# Altium schematic sheet IMU.SchDoc
size A4; SheetNumber: 1; SheetTotal: 1
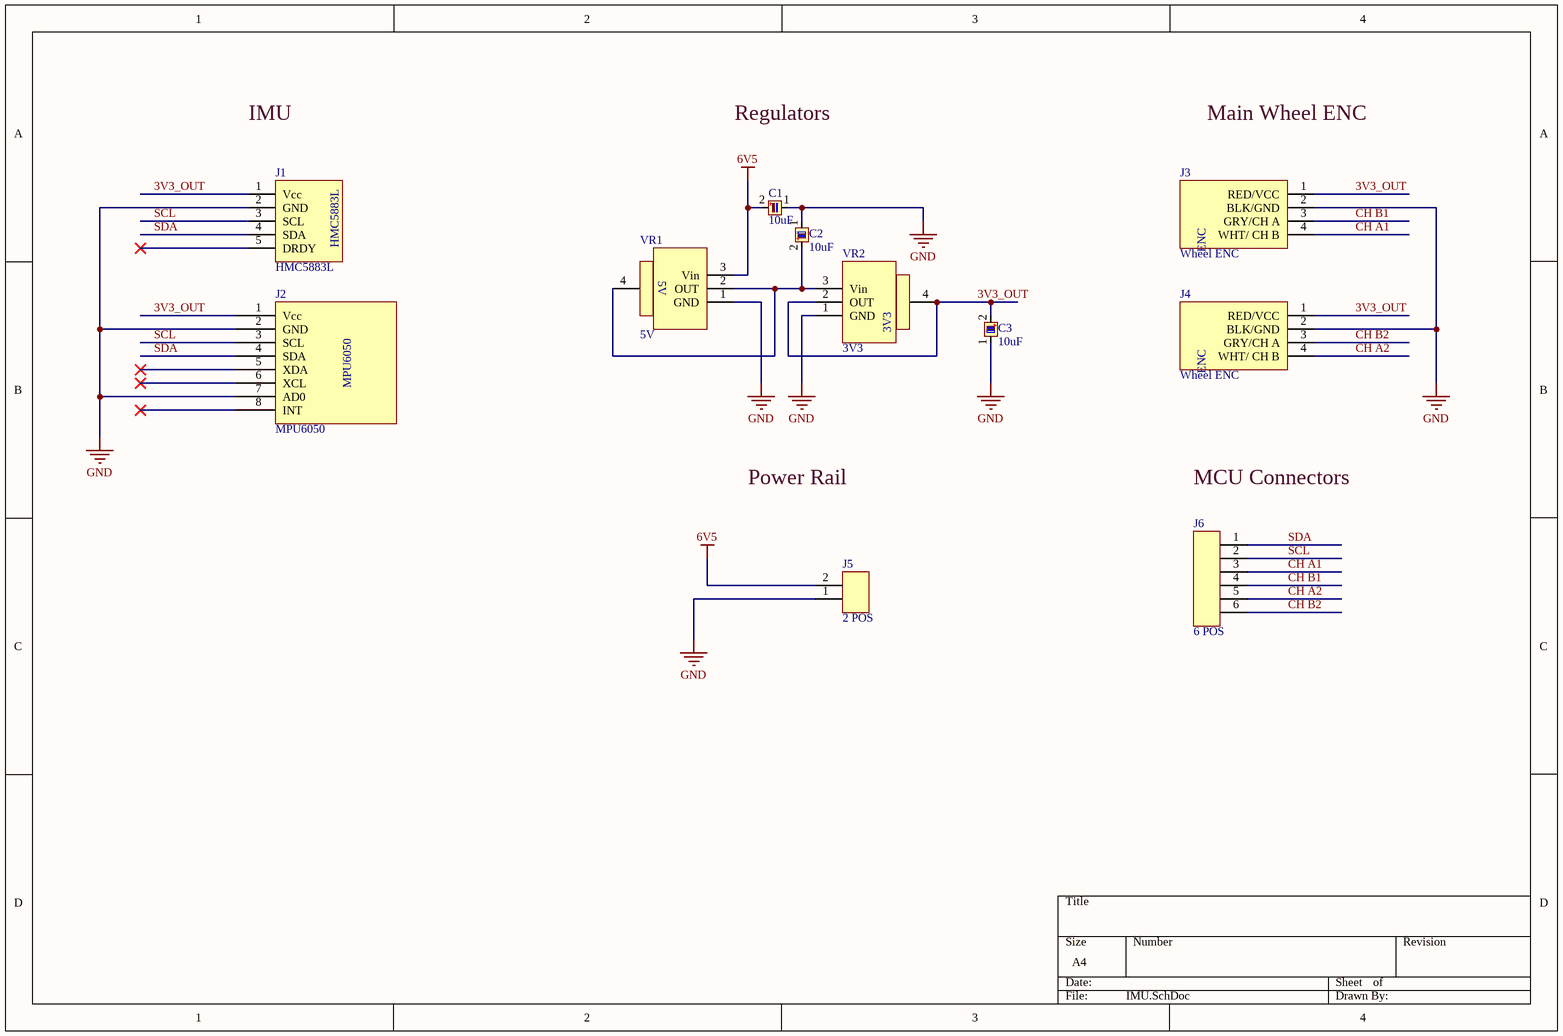
[diagram p0: IMU.SchDoc]

## Parts
C1  10uF  [10uF]
C2  10uF  [10uF]
C3  10uF  [10uF]
J1  HMC5883L  [5 POS HMC]
J2  MPU6050  [8 POS MPU6050]
J3  Wheel ENC  [Wheel ENC]
J4  Wheel ENC  [Wheel ENC]
J5  2 POS  [2 POS]
J6  6 POS  [6 POS]
VR1  5V  [3V3]
VR2  3V3  [3V3]

## Nets
6V5: C1.2 J5.2 VR1.3(Vin)
GND: C1.1 C2.1 C3.1 J1.2(GND) J2.2(GND) J2.7(AD0) J3.2(BLK/GND) J4.2(BLK/GND) J5.1 VR1.1(GND) VR2.1(GND)
3V3_OUT: C3.2 J1.1(Vcc) J2.1(Vcc) J3.1(RED/VCC) J4.1(RED/VCC) VR2.2(OUT) VR2.4(OUT)
CH A1: J3.4(WHT/_CH_B) J6.3
CH A2: J4.4(WHT/_CH_B) J6.5
CH B1: J3.3(GRY/CH_A) J6.4
CH B2: J4.3(GRY/CH_A) J6.6
SCL: J1.3(SCL) J2.3(SCL) J6.2
SDA: J1.4(SDA) J2.4(SDA) J6.1
NetC2_2: C2.2 VR1.2(OUT) VR1.4(OUT) VR2.3(Vin)

Not connected (* = marked no-connect by the designer): J1 5(DRDY)*; J2 5(XDA)* 6(XCL)* 8(INT)*

## Notes on the sheet
- IMU
- Regulators
- Main Wheel ENC
- Power Rail
- MCU Connectors
- (in symbol Wheel ENC) ENC

## Library data of the parts
C1-C3 = 10uF: Pin Header, Board-to-Board, Wire-to-Board, 2.54 mm, 1 Rows, 2 Contacts, Through Hole, HTSW Series; Manufacturer: Samtec; Manufacturer Part Number: HTSW-102-16-T-S; Manufacturer Lifecycle Status: PRODUCTION; Gender: Male; Number of Contacts: 2; Pitch: 2.54mm; Supplier: Avnet; Supplier Part Number: HTSW-102-16-T-S; RoHS: Compliant; Category: Board to Board Connectors; Stock: 2347; Pricing: 1=0.1485, 1000=0.06895, 5000=0.0494, 10000=0.0491, 20000=0.04881 (USD); Contact Material: Bronze; Contact Plating: Tin; Lead Pitch: 2.54mm; Lifecycle Status: Production; Mounting Technology: Through Hole; Number of Rows: 1; Packaging: Bulk; Radiation Hardening: No; REACH SVHC: No; Termination: Solder; ComponentLink1URL: https://datasheet.octopart.com:443/HTSW-102-16-T-S-Samtec-datasheet-97084101.pdf?src-supplier=Samtec; ComponentLink1Description: https://datasheet.octopart.com:443/HTSW-102-16-T-S-Samtec-datasheet-97084101.pdf?src-supplier=Samtec; ComponentLink2URL: https://sigma.octopart.com:443/14433675/technical_drawing/Samtec-HTSW-102-16-T-S.pdf?src-supplier=Samtec; ComponentLink2Description: https://sigma.octopart.com:443/14433675/technical_drawing/Samtec-HTSW-102-16-T-S.pdf?src-supplier=Samtec; ComponentLink3URL: https://datasheet.octopart.com:443/HTSW-102-16-T-S-Samtec-datasheet-150856372.pdf?src-supplier=Sager+Electronics; ComponentLink3Description: https://datasheet.octopart.com:443/HTSW-102-16-T-S-Samtec-datasheet-150856372.pdf?src-supplier=Sager+Electronics; ComponentLink4URL: https://datasheet.octopart.com:443/HTSW-102-16-T-S-Samtec-datasheet-151455181.pdf?src-supplier=Sager+Electronics; ComponentLink4Description: https://datasheet.octopart.com:443/HTSW-102-16-T-S-Samtec-datasheet-151455181.pdf?src-supplier=Sager+Electronics; ComponentLink5URL: https://datasheet.octopart.com:443/HTSW-102-16-T-S-Samtec-datasheet-136646178.pdf?src-supplier=Electro+Sonic; ComponentLink5Description: https://datasheet.octopart.com:443/HTSW-102-16-T-S-Samtec-datasheet-136646178.pdf?src-supplier=Electro+Sonic; ComponentLink6URL: https://datasheet.octopart.com:443/HTSW-102-16-T-S-Samtec-datasheet-62107121.pdf?src-supplier=Farnell; ComponentLink6Description: https://datasheet.octopart.com:443/HTSW-102-16-T-S-Samtec-datasheet-62107121.pdf?src-supplier=Farnell; ComponentLink7URL: https://datasheet.octopart.com:443/HTSW-102-16-T-S-Samtec-datasheet-180249195.pdf?src-supplier=JRH+Electronics; ComponentLink7Description: https://datasheet.octopart.com:443/HTSW-102-16-T-S-Samtec-datasheet-180249195.pdf?src-supplier=JRH+Electronics; ComponentLink8URL: https://datasheet.octopart.com/HTSW-102-16-T-S-Samtec-datasheet-86818365.pdf; ComponentLink8Description: https://datasheet.octopart.com/HTSW-102-16-T-S-Samtec-datasheet-86818365.pdf; ComponentLink9URL: https://datasheet.octopart.com:443/HTSW-102-16-T-S-Samtec-datasheet-21214457.pdf?src-supplier=Newark; ComponentLink9Description: https://datasheet.octopart.com:443/HTSW-102-16-T-S-Samtec-datasheet-21214457.pdf?src-supplier=Newark
J1 = 5 POS HMC: 4POS CONN HEADER VERT  2.54MM; Manufacturer: Samtec; Manufacturer Part Number: HTSW-104-23-T-S; Manufacturer Lifecycle Status: PRODUCTION; Gender: Male; Number of Contacts: 4; Supplier: DigiKey; Supplier Part Number: 612-HTSW-104-23-T-S-ND; RoHS: Compliant; Category: Board to Board Connectors; Pricing: 1=0.33 (USD); Contact Material: Bronze; Contact Plating: Tin; Lead Pitch: 2.54mm; Lifecycle Status: Production; Mounting Technology: Through Hole; Number of Rows: 1; Packaging: Bulk; Pitch: 2.54mm; Radiation Hardening: No; REACH SVHC: No; Termination: Solder; ComponentLink1URL: https://datasheet.octopart.com:443/HTSW-104-23-T-S-Samtec-datasheet-97084101.pdf?src-supplier=Samtec; ComponentLink1Description: https://datasheet.octopart.com:443/HTSW-104-23-T-S-Samtec-datasheet-97084101.pdf?src-supplier=Samtec; ComponentLink2URL: https://sigma.octopart.com:443/14433675/technical_drawing/Samtec-HTSW-104-23-T-S.pdf?src-supplier=Samtec; ComponentLink2Description: https://sigma.octopart.com:443/14433675/technical_drawing/Samtec-HTSW-104-23-T-S.pdf?src-supplier=Samtec; ComponentLink3URL: https://datasheet.octopart.com:443/HTSW-104-23-T-S-Samtec-datasheet-136646178.pdf?src-supplier=Electro+Sonic; ComponentLink3Description: https://datasheet.octopart.com:443/HTSW-104-23-T-S-Samtec-datasheet-136646178.pdf?src-supplier=Electro+Sonic; ComponentLink4URL: https://datasheet.octopart.com:443/HTSW-104-23-T-S-Samtec-datasheet-150856372.pdf?src-supplier=Electro+Sonic; ComponentLink4Description: https://datasheet.octopart.com:443/HTSW-104-23-T-S-Samtec-datasheet-150856372.pdf?src-supplier=Electro+Sonic; ComponentLink5URL: https://datasheet.octopart.com:443/HTSW-104-23-T-S-Samtec-datasheet-62107121.pdf?src-supplier=Farnell; ComponentLink5Description: https://datasheet.octopart.com:443/HTSW-104-23-T-S-Samtec-datasheet-62107121.pdf?src-supplier=Farnell; ComponentLink6URL: https://datasheet.octopart.com:443/HTSW-104-23-T-S-Samtec-datasheet-180249195.pdf?src-supplier=JRH+Electronics; ComponentLink6Description: https://datasheet.octopart.com:443/HTSW-104-23-T-S-Samtec-datasheet-180249195.pdf?src-supplier=JRH+Electronics; ComponentLink7URL: https://datasheet.octopart.com:443/HTSW-104-23-T-S-Samtec-datasheet-151455181.pdf?src-supplier=Sager+Electronics; ComponentLink7Description: https://datasheet.octopart.com:443/HTSW-104-23-T-S-Samtec-datasheet-151455181.pdf?src-supplier=Sager+Electronics; ComponentLink8URL: https://datasheet.octopart.com/HTSW-104-23-T-S-Samtec-datasheet-86818365.pdf; ComponentLink8Description: https://datasheet.octopart.com/HTSW-104-23-T-S-Samtec-datasheet-86818365.pdf; ComponentLink9URL: https://datasheet.octopart.com:443/HTSW-104-23-T-S-Samtec-datasheet-21214457.pdf?src-supplier=Newark; ComponentLink9Description: https://datasheet.octopart.com:443/HTSW-104-23-T-S-Samtec-datasheet-21214457.pdf?src-supplier=Newark
J2 = 8 POS MPU6050: Strip Terminal Block, 8A, 0.5mm2, 1 Row(s), 1 Deck(s); Manufacturer: Phoenix Contact; Manufacturer Part Number: 1945151; Manufacturer Lifecycle Status: AVAILABLE; Approvals: UL; Contact Resistance: 1.8mΩ; Current: 10A; Max Current Rating: 6A; Number of Contacts: 8; Number of Levels: 1; Pitch: 3.5mm; Voltage: 300V; Voltage Rating: 160V; Wire/Cable Gauge: 20AWG; Supplier: Mouser; Supplier Part Number: 651-1945151; RoHS: Compliant; Category: Terminal Blocks; Stock: 5397; Pricing: 1=0.76, 10=0.76, 50=0.76, 100=0.76, 1000=0.76, 10000=0.76 (USD); China RoHS: Compliant; Color: Black; Contact Plating: Tin; Country of Origin: Germany; Current Rating: 8A; Depth: 2.8mm; Export Control Classification Number (ECCN) Code: EAR99; Flammability Rating: UL94 V-0; Housing Color: Black; Harmonized Tariff Schedule (HTS) Code: 8536.90.40.00; Introduction Date: 2002-11-26; Lead Free: Lead Free; Lifecycle Status: Production; Mounting Technology: Solder; Pins: 8; Number of Positions: 8; Number of Positions Per Level: 8; Number of Rows: 1; Orientation: Straight; Packaging: Bulk; REACH SVHC: Unaffected; Termination: Solder; Weight: 869.990166mg; Width: 24.5mm; ComponentLink1URL: https://datasheet.octopart.com:443/1945151-Phoenix-Contact-datasheet-66579491.pdf?src-supplier=element14+APAC; ComponentLink1Description: https://datasheet.octopart.com:443/1945151-Phoenix-Contact-datasheet-66579491.pdf?src-supplier=element14+APAC; ComponentLink2URL: https://datasheet.octopart.com:443/PST-1.0/8-3.5-Phoenix-Contact-datasheet-8822167.pdf?src-supplier=element14+APAC; ComponentLink2Description: https://datasheet.octopart.com:443/PST-1.0/8-3.5-Phoenix-Contact-datasheet-8822167.pdf?src-supplier=element14+APAC; ComponentLink3URL: https://datasheet.octopart.com:443/1945151-Phoenix-Contact-datasheet-175456693.pdf?src-supplier=Master+Electronics; ComponentLink3Description: https://datasheet.octopart.com:443/1945151-Phoenix-Contact-datasheet-175456693.pdf?src-supplier=Master+Electronics; ComponentLink4URL: https://datasheet.octopart.com:443/1945151-Phoenix-Contact-datasheet-154783991.pdf?src-supplier=Electro+Sonic; ComponentLink4Description: https://datasheet.octopart.com:443/1945151-Phoenix-Contact-datasheet-154783991.pdf?src-supplier=Electro+Sonic; ComponentLink5URL: https://datasheet.octopart.com:443/1945151-Phoenix-Contact-datasheet-33525158.pdf?src-supplier=MRO+Stop; ComponentLink5Description: https://datasheet.octopart.com:443/1945151-Phoenix-Contact-datasheet-33525158.pdf?src-supplier=MRO+Stop; ComponentLink6URL: https://datasheet.octopart.com:443/1945151-Phoenix-Contact-datasheet-164875081.pdf?src-supplier=Burklin+Elektronik; ComponentLink6Description: https://datasheet.octopart.com:443/1945151-Phoenix-Contact-datasheet-164875081.pdf?src-supplier=Burklin+Elektronik; ComponentLink7URL: https://datasheet.octopart.com:443/1945151-Phoenix-Contact-datasheet-54101.pdf?src-supplier=DigiKey; ComponentLink7Description: https://datasheet.octopart.com:443/1945151-Phoenix-Contact-datasheet-54101.pdf?src-supplier=DigiKey; ComponentLink8URL: https://datasheet.octopart.com:443/1945151-Phoenix-Contact-datasheet-94777.pdf?src-supplier=RS+(Formerly+Allied+Electronics); ComponentLink8Description: https://datasheet.octopart.com:443/1945151-Phoenix-Contact-datasheet-94777.pdf?src-supplier=RS+(Formerly+Allied+Electronics); ComponentLink9URL: https://datasheet.octopart.com:443/1945151-Phoenix-Contact-datasheet-62084791.pdf?src-supplier=RS+(Formerly+Allied+Electronics); ComponentLink9Description: https://datasheet.octopart.com:443/1945151-Phoenix-Contact-datasheet-62084791.pdf?src-supplier=RS+(Formerly+Allied+Electronics); ComponentLink10URL: http://sigma.octopart.com:80/195219851/materials_sheet/Phoenix-Contact-1945151.pdf?src-supplier=Compliance+Statements; ComponentLink10Description: http://sigma.octopart.com:80/195219851/materials_sheet/Phoenix-Contact-1945151.pdf?src-supplier=Compliance+Statements
J3 J4 = Wheel ENC: 4POS CONN HEADER VERT  2.54MM; Manufacturer: Samtec; Manufacturer Part Number: HTSW-104-23-T-S; Manufacturer Lifecycle Status: PRODUCTION; Gender: Male; Number of Contacts: 4; Supplier: DigiKey; Supplier Part Number: 612-HTSW-104-23-T-S-ND; RoHS: Compliant; Category: Board to Board Connectors; Pricing: 1=0.33 (USD); Contact Material: Bronze; Contact Plating: Tin; Lead Pitch: 2.54mm; Lifecycle Status: Production; Mounting Technology: Through Hole; Number of Rows: 1; Packaging: Bulk; Pitch: 2.54mm; Radiation Hardening: No; REACH SVHC: No; Termination: Solder; ComponentLink1URL: https://datasheet.octopart.com:443/HTSW-104-23-T-S-Samtec-datasheet-97084101.pdf?src-supplier=Samtec; ComponentLink1Description: https://datasheet.octopart.com:443/HTSW-104-23-T-S-Samtec-datasheet-97084101.pdf?src-supplier=Samtec; ComponentLink2URL: https://sigma.octopart.com:443/14433675/technical_drawing/Samtec-HTSW-104-23-T-S.pdf?src-supplier=Samtec; ComponentLink2Description: https://sigma.octopart.com:443/14433675/technical_drawing/Samtec-HTSW-104-23-T-S.pdf?src-supplier=Samtec; ComponentLink3URL: https://datasheet.octopart.com:443/HTSW-104-23-T-S-Samtec-datasheet-136646178.pdf?src-supplier=Electro+Sonic; ComponentLink3Description: https://datasheet.octopart.com:443/HTSW-104-23-T-S-Samtec-datasheet-136646178.pdf?src-supplier=Electro+Sonic; ComponentLink4URL: https://datasheet.octopart.com:443/HTSW-104-23-T-S-Samtec-datasheet-150856372.pdf?src-supplier=Electro+Sonic; ComponentLink4Description: https://datasheet.octopart.com:443/HTSW-104-23-T-S-Samtec-datasheet-150856372.pdf?src-supplier=Electro+Sonic; ComponentLink5URL: https://datasheet.octopart.com:443/HTSW-104-23-T-S-Samtec-datasheet-62107121.pdf?src-supplier=Farnell; ComponentLink5Description: https://datasheet.octopart.com:443/HTSW-104-23-T-S-Samtec-datasheet-62107121.pdf?src-supplier=Farnell; ComponentLink6URL: https://datasheet.octopart.com:443/HTSW-104-23-T-S-Samtec-datasheet-180249195.pdf?src-supplier=JRH+Electronics; ComponentLink6Description: https://datasheet.octopart.com:443/HTSW-104-23-T-S-Samtec-datasheet-180249195.pdf?src-supplier=JRH+Electronics; ComponentLink7URL: https://datasheet.octopart.com:443/HTSW-104-23-T-S-Samtec-datasheet-151455181.pdf?src-supplier=Sager+Electronics; ComponentLink7Description: https://datasheet.octopart.com:443/HTSW-104-23-T-S-Samtec-datasheet-151455181.pdf?src-supplier=Sager+Electronics; ComponentLink8URL: https://datasheet.octopart.com/HTSW-104-23-T-S-Samtec-datasheet-86818365.pdf; ComponentLink8Description: https://datasheet.octopart.com/HTSW-104-23-T-S-Samtec-datasheet-86818365.pdf; ComponentLink9URL: https://datasheet.octopart.com:443/HTSW-104-23-T-S-Samtec-datasheet-21214457.pdf?src-supplier=Newark; ComponentLink9Description: https://datasheet.octopart.com:443/HTSW-104-23-T-S-Samtec-datasheet-21214457.pdf?src-supplier=Newark
VR1 = 5V: 10mA positive electrode fixed 3.3V 15V 6mV SOT-223 SMD mount 3.71mm(width)*1.8mm(height); Manufacturer: Analog Devices; Manufacturer Part Number: LT1117CST-3.3#PBF; Manufacturer Lifecycle Status: PRODUCTION; Dropout Voltage: 1.1V; Max Output current: 800mA; Min Input Voltage: 2.45V; Number of Channels: 1; Operating Supply Current: 5mA; Output Voltage Accuracy: 1%; Power Supply Rejection Ratio (PSRR): 75dB; Reference Voltage: 1.27V; Supplier: DigiKey; Supplier Part Number: 505-LT1117CST-3.3#PBF-ND; RoHS: Compliant; Category: LDO Voltage Regulators; Stock: 5446; Pricing: 1=7.96, 10=6.16, 78=5.28808, 156=5.09051, 312=4.92788, 546=4.81782, 1014=4.71464 (USD); Case/Package: SOT-223-3; Height: 1.8mm; Lead Free: Lead Free; Length: 6.71mm; Lifecycle Status: Production; Max Supply Voltage: 15V; Max Operating Temperature: 125°C; Min Current Limit: 800mA; Min Operating Temperature: 0°C; Mounting Technology: Surface Mount; Nominal Output Voltage: 3.3V; Number of Outputs: 1; Pins: 3; Number of Regulators: 1; Output Current: 800mA; Output Type: Fixed; Output Voltage: 3.3V; Packaging: Bulk; Polarity: Positive; Quiescent Current: 10mA; Radiation Hardening: No; REACH SVHC: Unaffected; Schedule B: 8542390000, 8542390000|8542390000|8542390000|8542390000|8542390000|8542390000|8542390000|8542390000|8542390000|8542390000|8542390000|8542390000|8542390000|8542390000|8542390000|8542390000|8542390000|8542390000|8542390000|8542390000|8542390000|8542390000|8542390000|85; Width: 3.71mm; ComponentLink1URL: https://datasheet.octopart.com:443/LT1117CST-3.3%23PBF-Analog-Devices-datasheet-10688060.pdf?src-supplier=element14+APAC; ComponentLink1Description: https://datasheet.octopart.com:443/LT1117CST-3.3%23PBF-Analog-Devices-datasheet-10688060.pdf?src-supplier=element14+APAC; ComponentLink2URL: https://octopart.com:443/opatz8j6/c1?t=sxPfvuRhnwazmxrmq8OcozQ_deCTcj93l61TCwHHAMrfHd1zMJUbDN1BQRyopVTPT06EZltW9au6ThzHazGz_K01nYGgQQbAqUW7xZoQbMQj_Tk9mo54BoGqI58goAQNKChcZH57xe3yJR3CLvqjnZIhvnC6ZUnXmbxCUgfO7NVBhd06IAa9UBMTy5__Do4QRO1H7gN19Bt_59SFkSqeidpjLdGkU2gnUhcEunfk7eyIcREwc1Qh4I3mNFWWaQ5DTh2xZX-NMPM0Sc5KZLLtUjKhzoxxlKwGl3cc6mUQ8r87b7CLjsspdA&src-supplier=Analog+Devices; ComponentLink2Description: https://octopart.com:443/opatz8j6/c1?t=sxPfvuRhnwazmxrmq8OcozQ_deCTcj93l61TCwHHAMrfHd1zMJUbDN1BQRyopVTPT06EZltW9au6ThzHazGz_K01nYGgQQbAqUW7xZoQbMQj_Tk9mo54BoGqI58goAQNKChcZH57xe3yJR3CLvqjnZIhvnC6ZUnXmbxCUgfO7NVBhd06IAa9UBMTy5__Do4QRO1H7gN19Bt_59SFkSqeidpjLdGkU2gnUhcEunfk7eyIcREwc1Qh4I3mNFWWaQ5DTh2xZX-NMPM0Sc5KZLLtUjKhzoxxlKwGl3cc6mUQ8r87b7CLjsspdA&src-supplier=Analog+Devices; ComponentLink3URL: https://datasheet.octopart.com:443/LT1117CST-3.3%23PBF-Linear-Technology-datasheet-501865.pdf?src-supplier=element14; ComponentLink3Description: https://datasheet.octopart.com:443/LT1117CST-3.3%23PBF-Linear-Technology-datasheet-501865.pdf?src-supplier=element14; ComponentLink4URL: https://datasheet.octopart.com:443/LT1117CST-3.3%23PBF-Analog-Devices-datasheet-11554267.pdf?src-supplier=SOS+electronic; ComponentLink4Description: https://datasheet.octopart.com:443/LT1117CST-3.3%23PBF-Analog-Devices-datasheet-11554267.pdf?src-supplier=SOS+electronic; ComponentLink5URL: https://sigma.octopart.com:443/57690395/technical_drawing/Linear-Technology-LT1117CST-3.3%23PBF.pdf?src-supplier=Linear+Technology; ComponentLink5Description: https://sigma.octopart.com:443/57690395/technical_drawing/Linear-Technology-LT1117CST-3.3%23PBF.pdf?src-supplier=Linear+Technology; ComponentLink6URL: https://datasheet.octopart.com:443/LT1117CST-3.3%23PBF-Linear-Technology-datasheet-8209746.pdf?src-supplier=Jameco+(USA); ComponentLink6Description: https://datasheet.octopart.com:443/LT1117CST-3.3%23PBF-Linear-Technology-datasheet-8209746.pdf?src-supplier=Jameco+(USA); ComponentLink7URL: http://sigma.octopart.com:80/conflict_mineral_statement/Analog-Devices-company-33.pdf?src-supplier=Compliance+Statements; ComponentLink7Description: http://sigma.octopart.com:80/conflict_mineral_statement/Analog-Devices-company-33.pdf?src-supplier=Compliance+Statements; ComponentLink8URL: https://octopart.com:443/opatz8j6/c1?t=Itd0_Rzn44atCgyqqsaW9vqyNROmcDdOOlmDNuHQy5sG6RlJFqPrF18Q09GdkdA4DnnOnQyFiKa-xTy84isrbvQcKhyHdREctLTuDeXElH90lmN1SFw106Zq8a491SeXECFg075oa3RZHoUhm261CrSHgUqgifs4IJe2bcS4VG6cTp0XbT4a9-5BFrudppU15yqarzS6nzIestfbH4UNq1eEbTliTQbkkowoZRDFvmMPpk22GyonWMwg9GqKAKAtjcwvRjM6GvyXDZLmJkvlZxPaACvllw-u3xX1LKWDQgG40xXiC5YhaA&src-supplier=Compliance+Statements; ComponentLink8Description: https://octopart.com:443/opatz8j6/c1?t=Itd0_Rzn44atCgyqqsaW9vqyNROmcDdOOlmDNuHQy5sG6RlJFqPrF18Q09GdkdA4DnnOnQyFiKa-xTy84isrbvQcKhyHdREctLTuDeXElH90lmN1SFw106Zq8a491SeXECFg075oa3RZHoUhm261CrSHgUqgifs4IJe2bcS4VG6cTp0XbT4a9-5BFrudppU15yqarzS6nzIestfbH4UNq1eEbTliTQbkkowoZRDFvmMPpk22GyonWMwg9GqKAKAtjcwvRjM6GvyXDZLmJkvlZxPaACvllw-u3xX1LKWDQgG40xXiC5YhaA&src-supplier=Compliance+Statements
VR2 = 3V3: 10mA positive electrode fixed 3.3V 15V 6mV SOT-223 SMD mount 3.71mm(width)*1.8mm(height); Manufacturer: Analog Devices; Manufacturer Part Number: LT1117CST-3.3#PBF; Manufacturer Lifecycle Status: PRODUCTION; Dropout Voltage: 1.1V; Max Output current: 800mA; Min Input Voltage: 2.45V; Number of Channels: 1; Operating Supply Current: 5mA; Output Voltage Accuracy: 1%; Power Supply Rejection Ratio (PSRR): 75dB; Reference Voltage: 1.27V; Supplier: DigiKey; Supplier Part Number: 505-LT1117CST-3.3#PBF-ND; RoHS: Compliant; Category: LDO Voltage Regulators; Stock: 5446; Pricing: 1=7.96, 10=6.16, 78=5.28808, 156=5.09051, 312=4.92788, 546=4.81782, 1014=4.71464 (USD); Case/Package: SOT-223-3; Height: 1.8mm; Lead Free: Lead Free; Length: 6.71mm; Lifecycle Status: Production; Max Supply Voltage: 15V; Max Operating Temperature: 125°C; Min Current Limit: 800mA; Min Operating Temperature: 0°C; Mounting Technology: Surface Mount; Nominal Output Voltage: 3.3V; Number of Outputs: 1; Pins: 3; Number of Regulators: 1; Output Current: 800mA; Output Type: Fixed; Output Voltage: 3.3V; Packaging: Bulk; Polarity: Positive; Quiescent Current: 10mA; Radiation Hardening: No; REACH SVHC: Unaffected; Schedule B: 8542390000, 8542390000|8542390000|8542390000|8542390000|8542390000|8542390000|8542390000|8542390000|8542390000|8542390000|8542390000|8542390000|8542390000|8542390000|8542390000|8542390000|8542390000|8542390000|8542390000|8542390000|8542390000|8542390000|8542390000|85; Width: 3.71mm; ComponentLink1URL: https://datasheet.octopart.com:443/LT1117CST-3.3%23PBF-Analog-Devices-datasheet-10688060.pdf?src-supplier=element14+APAC; ComponentLink1Description: https://datasheet.octopart.com:443/LT1117CST-3.3%23PBF-Analog-Devices-datasheet-10688060.pdf?src-supplier=element14+APAC; ComponentLink2URL: https://octopart.com:443/opatz8j6/c1?t=sxPfvuRhnwazmxrmq8OcozQ_deCTcj93l61TCwHHAMrfHd1zMJUbDN1BQRyopVTPT06EZltW9au6ThzHazGz_K01nYGgQQbAqUW7xZoQbMQj_Tk9mo54BoGqI58goAQNKChcZH57xe3yJR3CLvqjnZIhvnC6ZUnXmbxCUgfO7NVBhd06IAa9UBMTy5__Do4QRO1H7gN19Bt_59SFkSqeidpjLdGkU2gnUhcEunfk7eyIcREwc1Qh4I3mNFWWaQ5DTh2xZX-NMPM0Sc5KZLLtUjKhzoxxlKwGl3cc6mUQ8r87b7CLjsspdA&src-supplier=Analog+Devices; ComponentLink2Description: https://octopart.com:443/opatz8j6/c1?t=sxPfvuRhnwazmxrmq8OcozQ_deCTcj93l61TCwHHAMrfHd1zMJUbDN1BQRyopVTPT06EZltW9au6ThzHazGz_K01nYGgQQbAqUW7xZoQbMQj_Tk9mo54BoGqI58goAQNKChcZH57xe3yJR3CLvqjnZIhvnC6ZUnXmbxCUgfO7NVBhd06IAa9UBMTy5__Do4QRO1H7gN19Bt_59SFkSqeidpjLdGkU2gnUhcEunfk7eyIcREwc1Qh4I3mNFWWaQ5DTh2xZX-NMPM0Sc5KZLLtUjKhzoxxlKwGl3cc6mUQ8r87b7CLjsspdA&src-supplier=Analog+Devices; ComponentLink3URL: https://datasheet.octopart.com:443/LT1117CST-3.3%23PBF-Linear-Technology-datasheet-501865.pdf?src-supplier=element14; ComponentLink3Description: https://datasheet.octopart.com:443/LT1117CST-3.3%23PBF-Linear-Technology-datasheet-501865.pdf?src-supplier=element14; ComponentLink4URL: https://datasheet.octopart.com:443/LT1117CST-3.3%23PBF-Analog-Devices-datasheet-11554267.pdf?src-supplier=SOS+electronic; ComponentLink4Description: https://datasheet.octopart.com:443/LT1117CST-3.3%23PBF-Analog-Devices-datasheet-11554267.pdf?src-supplier=SOS+electronic; ComponentLink5URL: https://sigma.octopart.com:443/57690395/technical_drawing/Linear-Technology-LT1117CST-3.3%23PBF.pdf?src-supplier=Linear+Technology; ComponentLink5Description: https://sigma.octopart.com:443/57690395/technical_drawing/Linear-Technology-LT1117CST-3.3%23PBF.pdf?src-supplier=Linear+Technology; ComponentLink6URL: https://datasheet.octopart.com:443/LT1117CST-3.3%23PBF-Linear-Technology-datasheet-8209746.pdf?src-supplier=Jameco+(USA); ComponentLink6Description: https://datasheet.octopart.com:443/LT1117CST-3.3%23PBF-Linear-Technology-datasheet-8209746.pdf?src-supplier=Jameco+(USA); ComponentLink7URL: http://sigma.octopart.com:80/conflict_mineral_statement/Analog-Devices-company-33.pdf?src-supplier=Compliance+Statements; ComponentLink7Description: http://sigma.octopart.com:80/conflict_mineral_statement/Analog-Devices-company-33.pdf?src-supplier=Compliance+Statements; ComponentLink8URL: https://octopart.com:443/opatz8j6/c1?t=Itd0_Rzn44atCgyqqsaW9vqyNROmcDdOOlmDNuHQy5sG6RlJFqPrF18Q09GdkdA4DnnOnQyFiKa-xTy84isrbvQcKhyHdREctLTuDeXElH90lmN1SFw106Zq8a491SeXECFg075oa3RZHoUhm261CrSHgUqgifs4IJe2bcS4VG6cTp0XbT4a9-5BFrudppU15yqarzS6nzIestfbH4UNq1eEbTliTQbkkowoZRDFvmMPpk22GyonWMwg9GqKAKAtjcwvRjM6GvyXDZLmJkvlZxPaACvllw-u3xX1LKWDQgG40xXiC5YhaA&src-supplier=Compliance+Statements; ComponentLink8Description: https://octopart.com:443/opatz8j6/c1?t=Itd0_Rzn44atCgyqqsaW9vqyNROmcDdOOlmDNuHQy5sG6RlJFqPrF18Q09GdkdA4DnnOnQyFiKa-xTy84isrbvQcKhyHdREctLTuDeXElH90lmN1SFw106Zq8a491SeXECFg075oa3RZHoUhm261CrSHgUqgifs4IJe2bcS4VG6cTp0XbT4a9-5BFrudppU15yqarzS6nzIestfbH4UNq1eEbTliTQbkkowoZRDFvmMPpk22GyonWMwg9GqKAKAtjcwvRjM6GvyXDZLmJkvlZxPaACvllw-u3xX1LKWDQgG40xXiC5YhaA&src-supplier=Compliance+Statements